# Altium schematic sheet MEMORY.SchDoc
size A4; SheetNumber: 2; SheetTotal: 9
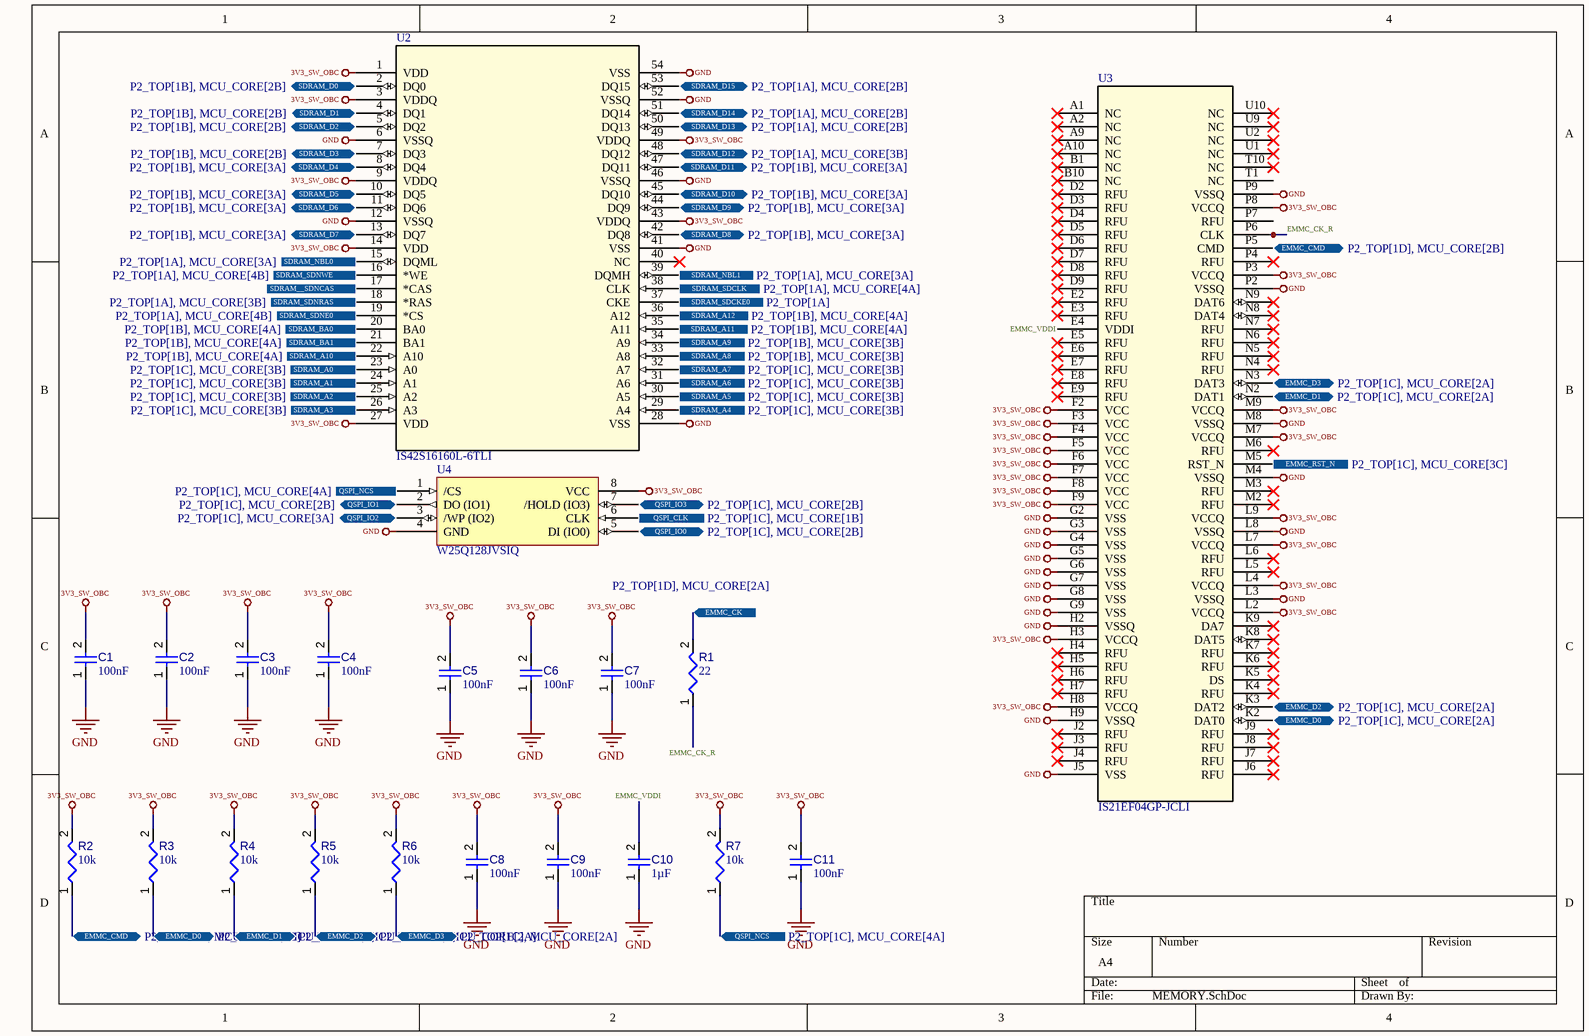
[diagram p0: MEMORY.SchDoc]

## Parts
C1  value 100nF  [CAPC0402(1005)60_L]  (hidden comment: Capacitor 100nF +/-20% 25V 0402)
C2  value 100nF  [CAPC0402(1005)60_L]  (hidden comment: Capacitor 100nF +/-20% 25V 0402)
C3  value 100nF  [CAPC0402(1005)60_L]  (hidden comment: Capacitor 100nF +/-20% 25V 0402)
C4  value 100nF  [CAPC0402(1005)60_L]  (hidden comment: Capacitor 100nF +/-20% 25V 0402)
C5  value 100nF  [CAPC0402(1005)60_L]  (hidden comment: Capacitor 100nF +/-20% 25V 0402)
C6  value 100nF  [CAPC0402(1005)60_L]  (hidden comment: Capacitor 100nF +/-20% 25V 0402)
C7  value 100nF  [CAPC0402(1005)60_L]  (hidden comment: Capacitor 100nF +/-20% 25V 0402)
C8  value 100nF  [CAPC0402(1005)60_L]  (hidden comment: Capacitor 100nF +/-20% 25V 0402)
C9  value 100nF  [CAPC0402(1005)60_L]  (hidden comment: Capacitor 100nF +/-20% 25V 0402)
C10  value 1µF  [CAPC0603(1608)100_L]  (hidden comment: Capacitor 1µF +/-40% 50V 0603)
C11  value 100nF  [CAPC0402(1005)60_L]  (hidden comment: Capacitor 100nF +/-20% 25V 0402)
R1  value 22  [RESC0402(1005)_L]  (hidden comment: Resistor 22R  +/-5 % 0402 63 mW)
R2  value 10k  [RESC1005X40X25ML05T05]  (hidden comment: Resistor 10k +/-1% 0402 100 mW)
R3  value 10k  [RESC1005X40X25ML05T05]  (hidden comment: Resistor 10k +/-1% 0402 100 mW)
R4  value 10k  [RESC1005X40X25ML05T05]  (hidden comment: Resistor 10k +/-1% 0402 100 mW)
R5  value 10k  [RESC1005X40X25ML05T05]  (hidden comment: Resistor 10k +/-1% 0402 100 mW)
R6  value 10k  [RESC1005X40X25ML05T05]  (hidden comment: Resistor 10k +/-1% 0402 100 mW)
R7  value 10k  [RESC1005X40X25ML05T05]  (hidden comment: Resistor 10k +/-1% 0402 100 mW)
U2  IS42S16160L-6TLI  [IS42S16160L-6TLI-Footprint-1]
U3  IS21EF04GP-JCLI  [IS21EF04GP-JCLI-Footprint-1]
U4  W25Q128JVSIQ  [W25Q128JVSIQ-Footprint-1]

## Ports
EMMC_CK (in, see P2_TOP[1D], MCU_CORE[2A]), EMMC_CMD (bidir, see P2_TOP[1D], MCU_CORE[2B]), EMMC_D0 (bidir, see P2_TOP[1C], MCU_CORE[2A]), EMMC_D1 (bidir, see P2_TOP[1C], MCU_CORE[2A]), EMMC_D2 (bidir, see P2_TOP[1C], MCU_CORE[2A]), EMMC_D3 (bidir, see P2_TOP[1C], MCU_CORE[2A]), EMMC_RST_N (in, see P2_TOP[1C], MCU_CORE[3C]), QSPI_CLK (in, see P2_TOP[1C], MCU_CORE[1B]), QSPI_IO0 (bidir, see P2_TOP[1C], MCU_CORE[2B]), QSPI_IO1 (bidir, see P2_TOP[1C], MCU_CORE[2B]), QSPI_IO2 (bidir, see P2_TOP[1C], MCU_CORE[3A]), QSPI_IO3 (bidir, see P2_TOP[1C], MCU_CORE[2B]), QSPI_NCS (in, see P2_TOP[1C], MCU_CORE[4A]), SDRAM__SDNCAS (in), SDRAM_A0 (in, see P2_TOP[1C], MCU_CORE[3B]), SDRAM_A1 (in, see P2_TOP[1C], MCU_CORE[3B]), SDRAM_A2 (in, see P2_TOP[1C], MCU_CORE[3B]), SDRAM_A3 (in, see P2_TOP[1C], MCU_CORE[3B]), SDRAM_A4 (in, see P2_TOP[1C], MCU_CORE[3B]), SDRAM_A5 (in, see P2_TOP[1C], MCU_CORE[3B]), SDRAM_A6 (in, see P2_TOP[1C], MCU_CORE[3B]), SDRAM_A7 (in, see P2_TOP[1C], MCU_CORE[3B]), SDRAM_A8 (in, see P2_TOP[1B], MCU_CORE[3B]), SDRAM_A9 (in, see P2_TOP[1B], MCU_CORE[3B]), SDRAM_A10 (in, see P2_TOP[1B], MCU_CORE[4A]), SDRAM_A11 (in, see P2_TOP[1B], MCU_CORE[4A]), SDRAM_A12 (in, see P2_TOP[1B], MCU_CORE[4A]), SDRAM_BA0 (in, see P2_TOP[1B], MCU_CORE[4A]), SDRAM_BA1 (in, see P2_TOP[1B], MCU_CORE[4A]), SDRAM_D0 (bidir, see P2_TOP[1B], MCU_CORE[2B]), SDRAM_D1 (bidir, see P2_TOP[1B], MCU_CORE[2B]), SDRAM_D2 (bidir, see P2_TOP[1B], MCU_CORE[2B]), SDRAM_D3 (bidir, see P2_TOP[1B], MCU_CORE[2B]), SDRAM_D4 (bidir, see P2_TOP[1B], MCU_CORE[3A]), SDRAM_D5 (bidir, see P2_TOP[1B], MCU_CORE[3A]), SDRAM_D6 (bidir, see P2_TOP[1B], MCU_CORE[3A]), SDRAM_D7 (bidir, see P2_TOP[1B], MCU_CORE[3A]), SDRAM_D8 (bidir, see P2_TOP[1B], MCU_CORE[3A]), SDRAM_D9 (bidir, see P2_TOP[1B], MCU_CORE[3A]), SDRAM_D10 (bidir, see P2_TOP[1B], MCU_CORE[3A]), SDRAM_D11 (bidir, see P2_TOP[1B], MCU_CORE[3A]), SDRAM_D12 (bidir, see P2_TOP[1A], MCU_CORE[3B]), SDRAM_D13 (bidir, see P2_TOP[1A], MCU_CORE[2B]), SDRAM_D14 (bidir, see P2_TOP[1A], MCU_CORE[2B]), SDRAM_D15 (bidir, see P2_TOP[1A], MCU_CORE[2B]), SDRAM_NBL0 (in, see P2_TOP[1A], MCU_CORE[3A]), SDRAM_NBL1 (in, see P2_TOP[1A], MCU_CORE[3A]), SDRAM_SDCKE0 (in, see P2_TOP[1A]), SDRAM_SDCLK (in, see P2_TOP[1A], MCU_CORE[4A]), SDRAM_SDNE0 (in, see P2_TOP[1A], MCU_CORE[4B]), SDRAM_SDNRAS (in, see P2_TOP[1A], MCU_CORE[3B]), SDRAM_SDNWE (in, see P2_TOP[1A], MCU_CORE[4B])

## Nets
3V3_SW_OBC: C1.2 C2.2 C3.2 C4.2 C5.2 C6.2 C7.2 C8.2 C9.2 C11.2 R2.2 R3.2 R4.2 R5.2 R6.2 R7.2 U2.1(VDD) U2.3(VDDQ) U2.9(VDDQ) U2.14(VDD) U2.27(VDD) U2.43(VDDQ) U2.49(VDDQ) U3.F2(VCC) U3.F3(VCC) U3.F4(VCC) U3.F5(VCC) U3.F6(VCC) U3.F7(VCC) U3.F8(VCC) U3.F9(VCC) U3.H3(VCCQ) U3.H8(VCCQ) U3.L2(VCCQ) U3.L4(VCCQ) U3.L7(VCCQ) U3.L9(VCCQ) U3.M7(VCCQ) U3.M9(VCCQ) U3.P3(VCCQ) U3.P8(VCCQ) U4.8(VCC)
GND: C1.1 C2.1 C3.1 C4.1 C5.1 C6.1 C7.1 C8.1 C9.1 C10.1 C11.1 U2.6(VSSQ) U2.12(VSSQ) U2.28(VSS) U2.41(VSS) U2.46(VSSQ) U2.52(VSSQ) U2.54(VSS) U3.G2(VSS) U3.G3(VSS) U3.G4(VSS) U3.G5(VSS) U3.G6(VSS) U3.G7(VSS) U3.G8(VSS) U3.G9(VSS) U3.H2(VSSQ) U3.H9(VSSQ) U3.J5(VSS) U3.L3(VSSQ) U3.L8(VSSQ) U3.M4(VSSQ) U3.M8(VSSQ) U3.P2(VSSQ) U3.P9(VSSQ) U4.4(GND)
EMMC_CK: R1.2 ; port EMMC_CK
EMMC_CK_R: R1.1 U3.P6(CLK)
EMMC_CMD: R2.1 U3.P5(CMD) ; port EMMC_CMD
EMMC_D0: R3.1 U3.K2(DAT0) ; port EMMC_D0
EMMC_D1: R4.1 U3.N2(DAT1) ; port EMMC_D1
EMMC_D2: R5.1 U3.K3(DAT2) ; port EMMC_D2
EMMC_D3: R6.1 U3.N3(DAT3) ; port EMMC_D3
EMMC_RST_N: U3.M5(RST_N) ; port EMMC_RST_N
EMMC_VDDI: C10.2 U3.E4(VDDI)
QSPI_CLK: U4.6(CLK) ; port QSPI_CLK
QSPI_IO0: U4.5(DI_(IO0)) ; port QSPI_IO0
QSPI_IO1: U4.2(DO_(IO1)) ; port QSPI_IO1
QSPI_IO2: U4.3(/WP_(IO2)) ; port QSPI_IO2
QSPI_IO3: U4.7(/HOLD_(IO3)) ; port QSPI_IO3
QSPI_NCS: R7.1 U4.1(/CS) ; port QSPI_NCS
SDRAM__SDNCAS: U2.17(*CAS) ; port SDRAM__SDNCAS
SDRAM_A0: U2.23(A0) ; port SDRAM_A0
SDRAM_A1: U2.24(A1) ; port SDRAM_A1
SDRAM_A2: U2.25(A2) ; port SDRAM_A2
SDRAM_A3: U2.26(A3) ; port SDRAM_A3
SDRAM_A4: U2.29(A4) ; port SDRAM_A4
SDRAM_A5: U2.30(A5) ; port SDRAM_A5
SDRAM_A6: U2.31(A6) ; port SDRAM_A6
SDRAM_A7: U2.32(A7) ; port SDRAM_A7
SDRAM_A8: U2.33(A8) ; port SDRAM_A8
SDRAM_A9: U2.34(A9) ; port SDRAM_A9
SDRAM_A10: U2.22(A10) ; port SDRAM_A10
SDRAM_A11: U2.35(A11) ; port SDRAM_A11
SDRAM_A12: U2.36(A12) ; port SDRAM_A12
SDRAM_BA0: U2.20(BA0) ; port SDRAM_BA0
SDRAM_BA1: U2.21(BA1) ; port SDRAM_BA1
SDRAM_D0: U2.2(DQ0) ; port SDRAM_D0
SDRAM_D1: U2.4(DQ1) ; port SDRAM_D1
SDRAM_D2: U2.5(DQ2) ; port SDRAM_D2
SDRAM_D3: U2.7(DQ3) ; port SDRAM_D3
SDRAM_D4: U2.8(DQ4) ; port SDRAM_D4
SDRAM_D5: U2.10(DQ5) ; port SDRAM_D5
SDRAM_D6: U2.11(DQ6) ; port SDRAM_D6
SDRAM_D7: U2.13(DQ7) ; port SDRAM_D7
SDRAM_D8: U2.42(DQ8) ; port SDRAM_D8
SDRAM_D9: U2.44(DQ9) ; port SDRAM_D9
SDRAM_D10: U2.45(DQ10) ; port SDRAM_D10
SDRAM_D11: U2.47(DQ11) ; port SDRAM_D11
SDRAM_D12: U2.48(DQ12) ; port SDRAM_D12
SDRAM_D13: U2.50(DQ13) ; port SDRAM_D13
SDRAM_D14: U2.51(DQ14) ; port SDRAM_D14
SDRAM_D15: U2.53(DQ15) ; port SDRAM_D15
SDRAM_NBL0: U2.15(DQML) ; port SDRAM_NBL0
SDRAM_NBL1: U2.39(DQMH) ; port SDRAM_NBL1
SDRAM_SDCKE0: U2.37(CKE) ; port SDRAM_SDCKE0
SDRAM_SDCLK: U2.38(CLK) ; port SDRAM_SDCLK
SDRAM_SDNE0: U2.19(*CS) ; port SDRAM_SDNE0
SDRAM_SDNRAS: U2.18(*RAS) ; port SDRAM_SDNRAS
SDRAM_SDNWE: U2.16(*WE) ; port SDRAM_SDNWE

Not connected (* = marked no-connect by the designer): U2 40(NC)*; U3 A1(NC)* A2(NC)* A9(NC)* A10(NC)* B1(NC)* B10(NC)* D2(RFU)* D3(RFU)* D4(RFU)* D5(RFU)* D6(RFU)* D7(RFU)* D8(RFU)* D9(RFU)* E2(RFU)* E3(RFU)* E5(RFU)* E6(RFU)* E7(RFU)* E8(RFU)* E9(RFU)* H4(RFU)* H5(RFU)* H6(RFU)* H7(RFU)* J2(RFU)* J3(RFU)* J4(RFU)* J6(RFU)* J7(RFU)* J8(RFU)* J9(RFU)* K4(RFU)* K5(DS)* K6(RFU)* K7(RFU)* K8(DAT5)* K9(DA7)* L5(RFU)* L6(RFU)* M2(RFU)* M3(RFU)* M6(RFU)* N4(RFU)* N5(RFU)* N6(RFU)* N7(RFU)* N8(DAT4)* N9(DAT6)* P4(RFU)* P7(RFU) T1(NC) T10(NC)* U1(NC)* U2(NC)* U9(NC)* U10(NC)*

## Library data of the parts
C1-C9 C11 = CMP-001-00065-4: Chip Capacitor, 100nF +/-20%, 25V, 0402, Thickness 0.6 mm; Tolerance: 10%; Max Operating Temperature: 85°C; Min Operating Temperature: -55°C; Pins: 2; Voltage Rating: 25V; Mounting Technology: SMT; Case/Package: 0402
C10 = CMP-001-00078-4: Chip Capacitor, 1µF +/-40%, 50V, 0603, Thickness 1 mm; Tolerance: 10%; Case/Package: 0603; Pins: 2; Max Operating Temperature: 85°C; Voltage Rating: 50V; Mounting Technology: SMT; Min Operating Temperature: -55°C
R1 = CMP-009-00164-3: Chip Resistor, 22 Ohms, +/-5 %, 63 mW, -55 to 155 degC, 0402; Tolerance: 5%; Power: 63mW; Pins: 2; Min Operating Temperature: -55°C; Max Operating Temperature: 155°C; Case/Package: 0402
R2-R7 = CMP-009-00015-5: Chip Resistor, 10 KOhm, +/- 1%, 0.1 W, -55 to 155 degC, 0402 (1005 Metric); Voltage Rating: 50V; Power: 100mW; Case/Package: 0402; RoHS Compliant: True; Min Operating Temperature: -55°C; Mounting Technology: SM; Tolerance: 1%; Max Operating Temperature: 155°C; Pins: 2
U2 = CMP-020-00025-3: 256M, 3.3V, Sdram, 16Mx16, 166Mhz, 54 Pi;; Number of Circuits: 1; Access Time: 5.4ns; Min Supply Voltage: 3V; Max Supply Current: 160mA; Max Supply Voltage: 3.6V; Terminal Pitch: 800µm; REACH SVHC: Unaffected; Length: 22.22mm; Harmonized Tariff Schedule (HTS) Code: 8542.32.00.24; Introduction Date: 2022-01-25; Min Operating Temperature: -40°C; Lifecycle Status: Production; Max Operating Temperature: 85°C; RoHS: Compliant; Number of Ports: 1; Width: 10.16mm; Export Control Classification Number (ECCN) Code: EAR99; Height - Seated (Max): 1.2mm; Number of Terminals: 54; Nominal Supply Voltage (DC): 3.3V; Country of Origin: Mainland China, Taiwan
U3 = CMP-019-00054-3: Flash Memory, pSLC NAND, 4 Gbyte, 32G x 1bit, 8G x 4bit, 4G x 8bit, eMMC 5.1, 153 Pins, FBGA; Number of Circuits: 1; Max Supply Voltage: 3.6V; Min Supply Voltage: 2.7V; Max Supply Current: 45mA; Nominal Supply Voltage (DC): 3.3V; Lifecycle Status: Production; Length: 13mm; REACH SVHC: Unaffected; Width: 11.5mm; Height - Seated (Max): 1mm; Min Operating Temperature: -40°C; RoHS: Compliant; Terminal Pitch: 500µm; Max Operating Temperature: 85°C; Number of Terminals: 153
U4 = CMP-019-00055-2: NOR Flash Serial (SPI, Dual SPI, Quad SPI) 3.3V 128M-bit 16M x 8 6ns 8-Pin SOIC Tube; Min Supply Voltage: 2.7V; Nominal Supply Voltage (DC): 3V; Max Supply Voltage: 3.6V; Frequency: 104MHz; Max Supply Current: 20mA; Number of Circuits: 1; Memory Size: 16MB; Temperature Grade: Industrial; Number of Terminals: 8; Length: 5.23mm; Introduction Date: 2016-11-14; Height - Seated (Max): 2.16mm; China RoHS: Compliant; Min Operating Temperature: -40°C; Lifecycle Status: Production; Max Operating Temperature: 85°C; REACH SVHC: Unaffected; Height: 2.16mm; Country of Origin: Taiwan; Terminal Pitch: 1.27mm; RoHS: Compliant; Interface: SPI; Case/Package: SOP; Width: 5.23mm; Memory Format: FLASH; Export Control Classification Number (ECCN) Code: EAR99; Ambient Temperature Range High: 85°C; Harmonized Tariff Schedule (HTS) Code: 8542.32.00.51; Schedule B: 8542320070, 8542320070